# Altium project STM32F4_BerkwareDevBoard.PrjPcb
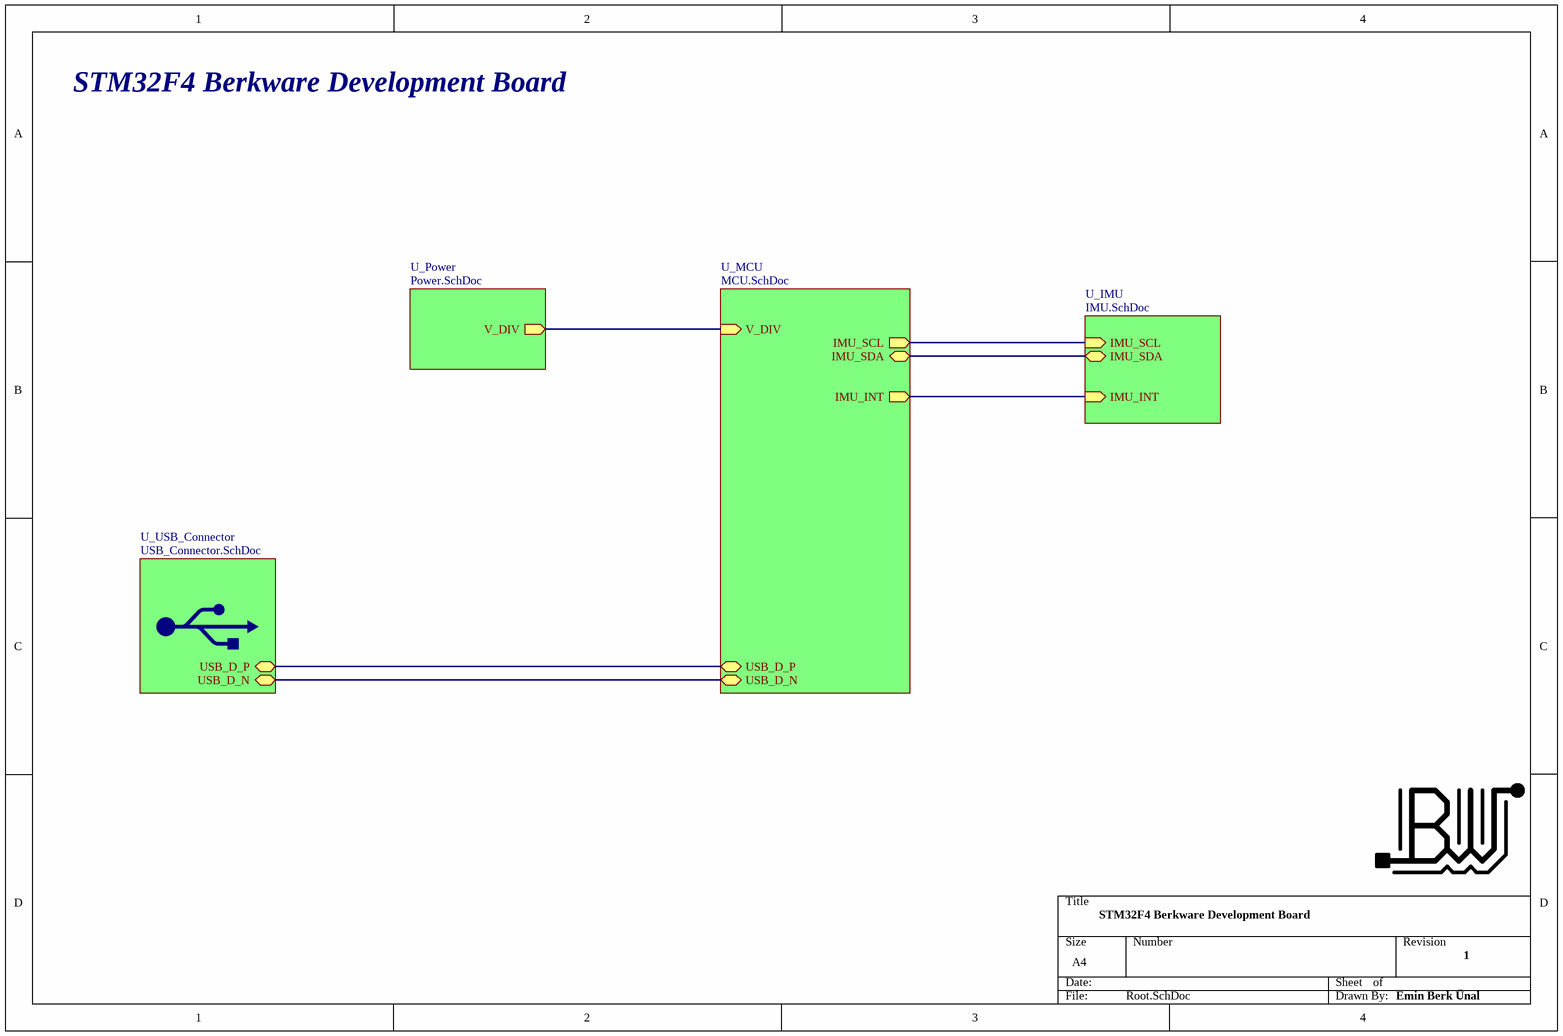
[diagram p0: Root.SchDoc]
5 sheets, 46 parts. Net scope: hierarchical (ports join the sheet entries above them; power ports are global).
Board file: STM32F4_BerkwareDevBoard.PcbDoc
Sheets:
  Root.SchDoc
    U_MCU = MCU.SchDoc
    U_IMU = IMU.SchDoc
    U_Power = Power.SchDoc
    U_USB_Connector = USB_Connector.SchDoc

## Sheet Root.SchDoc: STM32F4 Berkware Development Board
size A4; DrawnBy: Emin Berk Ünal; Revision: 1; SheetNumber: 1; SheetTotal: 5

### Sub-sheets
U_IMU = IMU.SchDoc: IMU_SCL (in), IMU_SDA (bidir), IMU_INT (in)
U_MCU = MCU.SchDoc: USB_D_P (bidir), USB_D_N (bidir), IMU_SCL (out), IMU_SDA (bidir), IMU_INT (out), V_DIV (in)
U_Power = Power.SchDoc: V_DIV (out)
U_USB_Connector = USB_Connector.SchDoc: USB_D_N (bidir), USB_D_P (bidir)

### Nets
IMU_INT: sheet U_MCU/IMU_INT, sheet U_IMU/IMU_INT
IMU_SCL: sheet U_MCU/IMU_SCL, sheet U_IMU/IMU_SCL
IMU_SDA: sheet U_MCU/IMU_SDA, sheet U_IMU/IMU_SDA
USB_D_N: sheet U_MCU/USB_D_N, sheet U_USB_Connector/USB_D_N
USB_D_P: sheet U_MCU/USB_D_P, sheet U_USB_Connector/USB_D_P
V_DIV: sheet U_MCU/V_DIV, sheet U_Power/V_DIV

### Notes on the sheet
- STM32F4 Berkware Development Board

## Sheet MCU.SchDoc
size A4; SheetNumber: 2; SheetTotal: 5
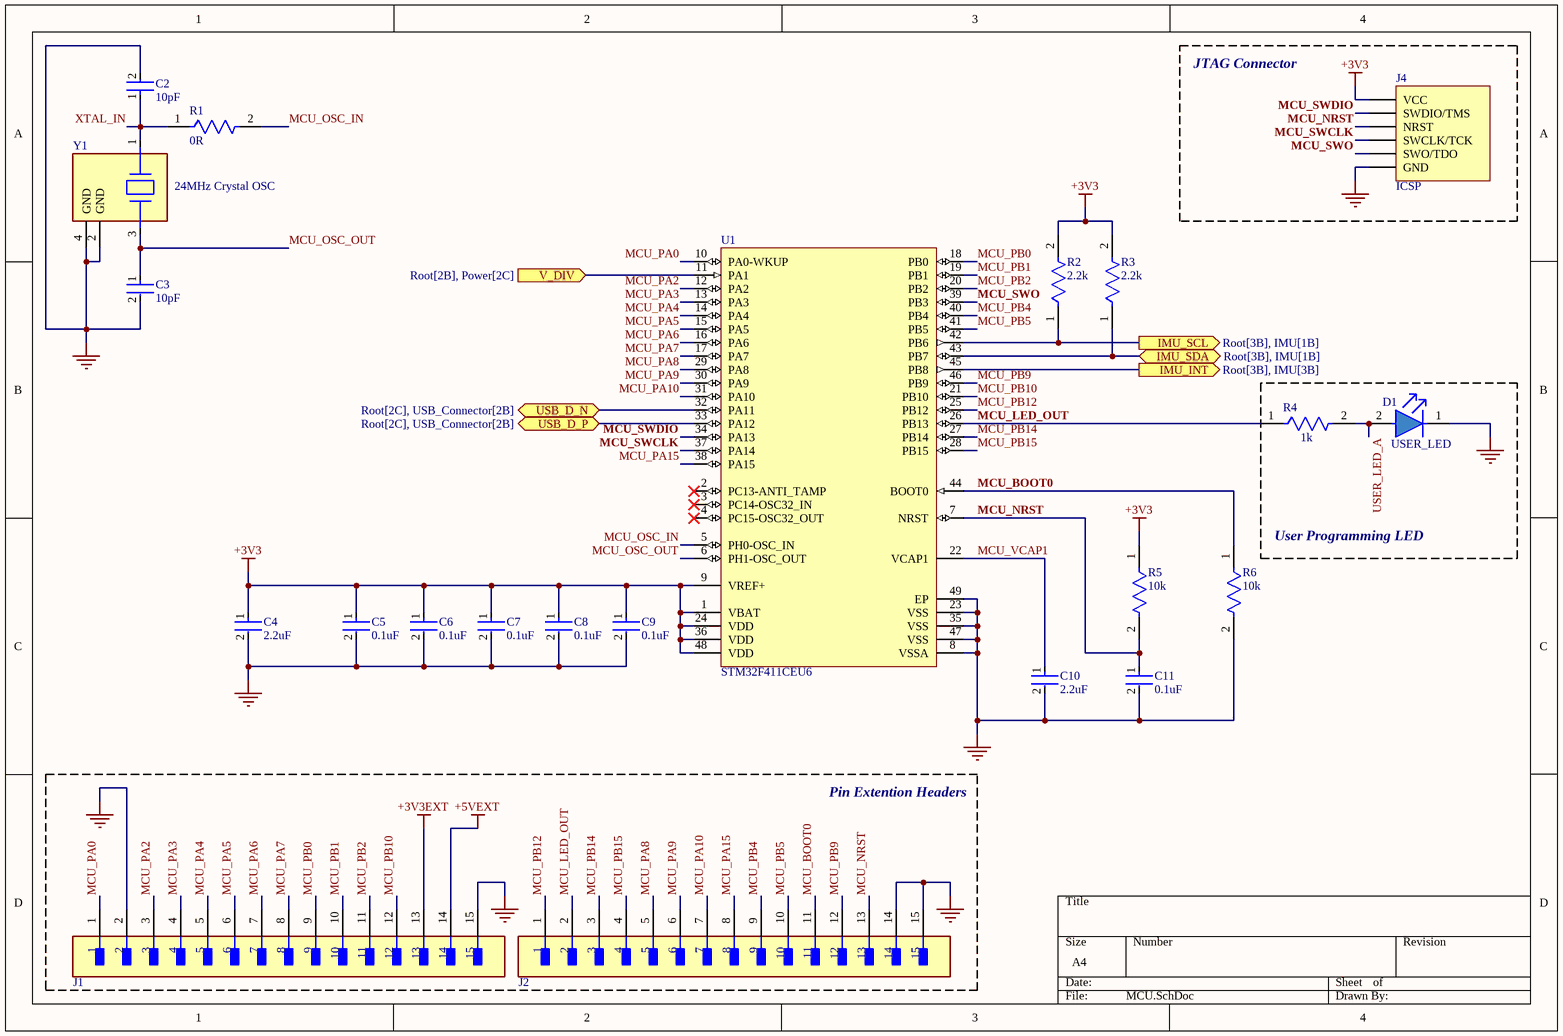
[diagram p1: MCU.SchDoc]

### Parts
C2  10pF  [FP-C0402-BB-MFG]
C3  10pF  [FP-C0402-BB-MFG]
C4  2.2uF  [FP-CC0603-DA-MFG]
C5  0.1uF  [FP-CC0402-MFG]
C6  0.1uF  [FP-CC0402-MFG]
C7  0.1uF  [FP-CC0402-MFG]
C8  0.1uF  [FP-CC0402-MFG]
C9  0.1uF  [FP-CC0402-MFG]
C10  2.2uF  [FP-CC0603-DA-MFG]
C11  0.1uF  [FP-CC0402-MFG]
D1  USER_LED  [FP-LTST-C191TBKT-MFG]
J1  TSW-115-23-T-S  [FP-TSW-115-23-T-S-MFG]  (value not drawn)
J2  TSW-115-23-T-S  [FP-TSW-115-23-T-S-MFG]  (value not drawn)
J4  ICSP  [TC2030-MCP-NL]  (no BOM)
R1  0R  [FP-MCS0402-MFG]
R2  2.2k  [FP-RT0402-MFG]
R3  2.2k  [FP-RT0402-MFG]
R4  1k  [FP-AT0402-MFG]
R5  10k  [FP-RT0402-MFG]
R6  10k  [FP-RT0402-MFG]
U1  STM32F411CEU6  [STM-UFQFPN48_L]
Y1  24MHz Crystal OSC  [FP-ABM10W-MFG]

### Blocks framed on the sheet
JTAG Connector: J4
User Programming LED: D1 R4

### Ports
IMU_INT (out, see Root[3B], IMU[3B]), IMU_SCL (out, see Root[3B], IMU[1B]), IMU_SDA (bidir, see Root[3B], IMU[1B]), USB_D_N (bidir, see Root[2C], USB_Connector[2B]), USB_D_P (bidir, see Root[2C], USB_Connector[2B]), V_DIV (in, see Root[2B], Power[2C])

### Nets
+3V3: C4.1 C5.1 C6.1 C7.1 C8.1 C9.1 J4.1(VCC) R2.2 R3.2 R5.1 U1.1(VBAT) U1.9(VREF+) U1.24(VDD) U1.36(VDD) U1.48(VDD)
+3V3EXT: J1.13
+5VEXT: J1.14
GND: C2.2 C3.2 C4.2 C5.2 C6.2 C7.2 C8.2 C9.2 C10.2 C11.2 D1.1(C) J1.2 J1.15 J2.14 J2.15 J4.5(GND) R6.2 U1.8(VSSA) U1.23(VSS) U1.35(VSS) U1.47(VSS) U1.49(EP) Y1.2(GND) Y1.4(GND)
IMU_INT: U1.45(PB8) ; port IMU_INT
IMU_SCL: R2.1 U1.42(PB6) ; port IMU_SCL
IMU_SDA: R3.1 U1.43(PB7) ; port IMU_SDA
MCU_BOOT0: J2.11 R6.1 U1.44(BOOT0)
MCU_LED_OUT: J2.2 R4.1 U1.26(PB13)
MCU_NRST: C11.1 J2.13 J4.3(NRST) R5.2 U1.7(NRST)
MCU_OSC_IN: R1.2 U1.5(PH0-OSC_IN)
MCU_OSC_OUT: C3.1 U1.6(PH1-OSC_OUT) Y1.3
MCU_PA0: J1.1 U1.10(PA0-WKUP)
MCU_PA2: J1.3 U1.12(PA2)
MCU_PA3: J1.4 U1.13(PA3)
MCU_PA4: J1.5 U1.14(PA4)
MCU_PA5: J1.6 U1.15(PA5)
MCU_PA6: J1.7 U1.16(PA6)
MCU_PA7: J1.8 U1.17(PA7)
MCU_PA8: J2.5 U1.29(PA8)
MCU_PA9: J2.6 U1.30(PA9)
MCU_PA10: J2.7 U1.31(PA10)
MCU_PA15: J2.8 U1.38(PA15)
MCU_PB0: J1.9 U1.18(PB0)
MCU_PB1: J1.10 U1.19(PB1)
MCU_PB2: J1.11 U1.20(PB2)
MCU_PB4: J2.9 U1.40(PB4)
MCU_PB5: J2.10 U1.41(PB5)
MCU_PB9: J2.12 U1.46(PB9)
MCU_PB10: J1.12 U1.21(PB10)
MCU_PB12: J2.1 U1.25(PB12)
MCU_PB14: J2.3 U1.27(PB14)
MCU_PB15: J2.4 U1.28(PB15)
MCU_SWCLK: J4.4(SWCLK/TCK) U1.37(PA14)
MCU_SWDIO: J4.2(SWDIO/TMS) U1.34(PA13)
MCU_SWO: J4.6(SWO/TDO) U1.39(PB3)
MCU_VCAP1: C10.1 U1.22(VCAP1)
USB_D_N: U1.32(PA11) ; port USB_D_N
USB_D_P: U1.33(PA12) ; port USB_D_P
USER_LED_A: D1.2(A) R4.2
V_DIV: U1.11(PA1) ; port V_DIV
XTAL_IN: C2.1 R1.1 Y1.1

Not connected (* = marked no-connect by the designer): U1 2(PC13-ANTI_TAMP)* 3(PC14-OSC32_IN)* 4(PC15-OSC32_OUT)*

### Notes on the sheet
- Pin Extention Headers

### Library data of the parts
C2 C3 = CMP-03020-018108-1: C0402 10 pF X7R 10.00% 16 V; Manufacturer: Kemet; Manufacturer Part Number: C0402C100K4RACAUTO; Tolerance: 0.1; Material: Ceramic; Temperature Coefficient: 15%; Voltage Rating: 16 V; Temperature: -55°C to +125°C; Ipc Land Pattern Name: CAPC10050X50; Temperature Characteristic: X7R; Automotive: No; ComponentLink2Description: Datasheet; Device Class L2: Capacitors; Temperature Range High: +125°C; ComponentLink2URL: https://content.kemet.com/datasheets/KEM_C1002_X7R_SMD.pdf; Device Class L1: Passive Components; Category: Cap; Value: 10 pF; Device Class L3: Ceramic Capacitors; Lead Free: Yes; Octopart: https://octopart.com/c0402c100k4racauto-kemet-91893731; RoHS: TRUE; Package: C0402-BB; Height: 0.55mm; Temperature Range Low: -55°C; Capacitance: 10 pF
C4 C10 = CMP-03422-000148-1: CAP CER 2.2UF 10V X7R 0603; Manufacturer: YAGEO; Manufacturer Part Number: CC0603KRX7R6BB225; Tolerance: 0.1; Temperature Coefficient: 15%; Material: Ceramic; Category: Cap; Temperature Range Low: -55°C; Device Class L1: Passive Components; ComponentLink2URL: http://www.yageo.com/documents/recent/UPY-GPHC_X7R_6.3V-to-50V_18.pdf; Value: 2.2 uF; Octopart: https://octopart.com/cc0603krx7r6bb225-yageo-20649696; Lead Free: Yes; Digikey Description: CAP CER 2.2UF 10V X7R 0603; Device Class L2: Capacitors; Height: 0.9mm; Package: CC0603-DA; Automotive: No; Voltage Rating: 10 V; Temperature Characteristic: X7R; Mouser Description: Multilayer Ceramic Capacitors MLCC - SMD/SMT 2.2uF 10V X7R 10%; Device Class L3: Ceramic Capacitors; Temperature Range High: +125°C; RoHS: TRUE; Temperature: -55°C to +125°C; Footprint Url: http://www.yageo.com/exep/pages/download/literatures/UPY-C_GEN_24.pdf; ComponentLink2Description: Datasheet; Voltage: 10 V; Capacitance: 2.2 uF
C5-C9 C11 = CMP-03422-001121-1: CAP CER 0.1UF 16V X7R 0402; Manufacturer: YAGEO; Manufacturer Part Number: CC0402KPX7R7BB104; Material: Ceramic; Temperature Coefficient: 30ppm/°C; Capacitance: 100 nF; Automotive Grade: NA; Value: 100 nF; Tolerance: 0.1; Digikey Description: CAP CER 0.1UF 16V X7R 0402; Temperature Range Low: -55°C; Footprint Url: http://www.yageo.com/exep/pages/download/literatures/UPY-C_GEN_24.pdf; RoHS: TRUE; Device Class L3: Ceramic Capacitors; Temperature Characteristic: X7R; Package: CC0402; Device Class L1: Passive Components; Lead Free: Yes; Temperature Range High: +125°C; Category: Cap; Mouser Description: 0402 0.1 uF 16 V ±10% Tolerance X7R SMT Multilayer Ceramic Capacitor; Voltage Rating: 16 V; ComponentLink2Description: Datasheet; Automotive: No; Octopart: https://octopart.com/cc0402kpx7r7bb104-yageo-21548559; ComponentLink2URL: http://www.yageo.com/documents/recent/UPY-GP_NP0_16V-to-50V_16.pdf; Height: 0.55mm; Device Class L2: Capacitors; Temperature: -55°C to +125°C; Ipc Land Pattern Name: CAPC10050X50
D1 = CMP-22017-000008-1: LED BLUE CLEAR CHIP SMD; Lens Color: Colorless; Dominant Wavelength: 475nm; Forward Current: 20mA; Wavelength: 468nm; Viewing Angle: 130°; Power Dissipation: 76mW; Luminous Intensity: 180mcd; Reverse Voltage: 5V; Number of Elements: 1; Lens Style: Diffused; Forward Voltage: 3.8V; Max Power Dissipation: 75mW; Case Code (Metric): 1608; Packaging: Tape and Reel; Case/Package: 0603; Depth: 1.6mm; Mount: Surface Mount; Lead Free: Lead Free; Min Operating Temperature: -20°C; Lens Transparency: Clear; Illumination Color: Blue; Height: 0.55mm; Test Current: 20mA; Case Code (Imperial): 0603; Max Operating Temperature: 80°C; Number of Pins: 2; Length: 0.8mm; Radiation Hardening: No; Package Quantity: 1; Number of LEDs: 1; Width: 0.8mm; Color: Blue
J1 J2 = CMP-02766-001466-1: CONN HEADER VERT 15POS 2.54MM; Connector Type: Male Pin; Number of Contacts: 15; Gender: Male; Pitch: 0.1inch; Termination: Solder; Packaging: Bulk; Lead Free: Lead Free; Housing Color: Black; Housing Material: Plastic; Color: Black; RoHS Compliant: Yes; Contact Type: Male Pin; Width: 2.54mm; Mount: Through Hole; Contact Material: Bronze; Number of Rows: 1; Radiation Hardening: No; Number of Positions: 15; Length: 38.1mm; REACH SVHC: No SVHC; Height: 2.54mm; Contact Plating: Tin; Series: TSW; Contact Mating Length: 0.23inch
R1 = CMP-02407-001042-1: RES SMD 1.2K OHM 1% 1/10W 0402; Resistance: 0mR; Voltage Rating: 50V; Max Power Dissipation: 100mW; Composition: Thin Film; Max Operating Temperature: 125°C; Number of Terminations: 2; Mount: Surface Mount; Packaging: Tape and Reel; REACH SVHC: No SVHC; Case Code (Metric): 1005; Package Quantity: 1; Radiation Hardening: No; Termination: Wraparound; Case Code (Imperial): 0402; Contact Plating: Tin; Depth: 0.5mm; Height: 0.015inch; Length: 1mm; Voltage Rating (DC): 50V; Power Rating: 100mW; Lead Free: Lead Free; Min Operating Temperature: -55°C; Military Standard: Not; Width: 0.02inch; Case/Package: 0402
R2 R3 = CMP-03412-019720-1: RES SMD 2.2K OHM 0.1% 1/16W 0402; Manufacturer: Yageo; Manufacturer Part Number: RT0402BRE072K2L; Power Rating: 0.063W; Temperature Coefficient: 50 ppm/°C; Value: 2.2KΩ; Tolerance: 0.001; Voltage Rating: 50V; ComponentLink2URL: http://www.yageo.com/documents/recent/PYu-RT_1-to-0.01_RoHS_L_9.pdf; RoHS: TRUE; Device Class L3: Chip SMD Resistors; Category: Res; Ipc Land Pattern Name: RESC10050X30; Series: RT; Lead Free: Yes; Device Class L1: Passive Components; Temperature Range Low: -55°C; Package: RT0402; Automotive: No; Octopart: https://octopart.com/rt0402bre072k2l-yageo-1445889; Temperature: -55°C to +155°C; Footprint Url: http://www.yageo.com/exep/pages/download/literatures/PYu-R_Mount_10.pdf; Composition: Thin Film; Resistance: 2.2KΩ; Temperature Range High: +155°C; Digikey Description: RES SMD 2.2K OHM 0.1% 1/16W 0402; Device Class L2: Resistors; ComponentLink2Description: Datasheet; Height: 0.35mm
R4 = CMP-03412-049230-1: Thin Film Chip Resistors Automotive Grade 1kΩ 1% 25ppm/°C 0402
R5 R6 = CMP-2002-02973-2: RES SMD 10K OHM 0.1% 1/16W 0402; Manufacturer Part Number: RT0402BRE0710KL; Manufacturer: Yageo; Power Rating: 0.063W; Resistance: 10KΩ; Temperature Coefficient: 50 ppm/°C; Tolerance: 0.001; Voltage Rating: 50V; Value: 10KΩ; Octopart: https://octopart.com/rt0402bre0710kl-yageo-1416557; Digikey Description: RES SMD 10K OHM 0.1% 1/16W 0402; Category: Res; Temperature Range Low: -55°C; Ipc Land Pattern Name: RESC10050X30; Automotive: No; Package: RT0402; Temperature: -55°C to +155°C; Series: RT; Lead Free: Yes; Device Class L3: Chip SMD Resistors; ComponentLink2URL: http://www.yageo.com/documents/recent/PYu-RT_1-to-0.01_RoHS_L_9.pdf; Height: 0.35mm; ComponentLink2Description: Datasheet; RoHS: TRUE; Composition: Thin Film; Device Class L2: Resistors; Device Class L1: Passive Components; Temperature Range High: +155°C; Footprint Url: http://www.yageo.com/exep/pages/download/literatures/PYu-R_Mount_10.pdf; Mouser Description: Res Thin Film 0402 10K Ohm 0.1% 1/16W ±50ppm/°C Molded SMD Paper T/R
U1 = CMP-0243-00165-1: ARM Cortex-M4 32-bit MCU+FPU, 512 KB Flash, 128 KB RAM, 36 I/Os, 48-Pin UFQFPN, -40 to 85 degC, Tray; Operating Frequency(F) (Processor speed) (MHz): 100; FLASH Size (Prog) (kB): 512; Internal RAM Size (kB): 128; I/Os (High Current): 36; Supply Voltage(Vcc) min (V): 1.7; Package Reference: 48-Pin Ultra Thin Fine Pitch Quad Flat No-Lead, 7 x 7 x 0.6 mm Body, 0.5 mm Pitch, Exposed Pad; ComponentLink1Description: Manufacturer URL; ComponentLink1URL: http://www.st.com/; Packing: Tray; Package Description: UFQFPN48; Core: ARM Cortex-M4; ComponentLink2Description: Datasheet; ComponentLink2URL: http://www.st.com/st-web-ui/static/active/en/resource/technical/document/datasheet/DM00115249.pdf; DatasheetVersion: Rev. 6; Mounting Technology: Surface Mount
Y1 = CMP-27762-001102-1: Crystal 24MHz ±20ppm 8pF SMD-4 2.5mm x 2mm

## Sheet IMU.SchDoc
size A4; SheetNumber: 3; SheetTotal: 5
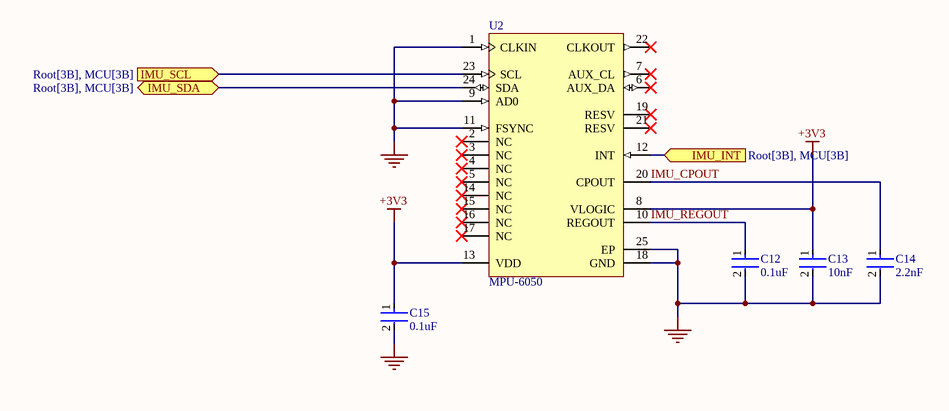
[diagram p2: IMU.SchDoc]

### Parts
C12  0.1uF  [FP-CC0402-MFG]
C13  10nF  [FP-C0402-BB-MFG]
C14  2.2nF  [FP-CC0402-MFG]
C15  0.1uF  [FP-CC0402-MFG]
U2  MPU-6050  [IS-QFN-24_V]

### Ports
IMU_INT (in, see Root[3B], MCU[3B]), IMU_SCL (in, see Root[3B], MCU[3B]), IMU_SDA (bidir, see Root[3B], MCU[3B])

### Nets
+3V3: C13.1 C15.1 U2.8(VLOGIC) U2.13(VDD)
GND: C12.2 C13.2 C14.2 C15.2 U2.1(CLKIN) U2.9(AD0) U2.11(FSYNC) U2.18(GND) U2.25(EP)
IMU_CPOUT: C14.1 U2.20(CPOUT)
IMU_INT: U2.12(INT) ; port IMU_INT
IMU_REGOUT: C12.1 U2.10(REGOUT)
IMU_SCL: U2.23(SCL) ; port IMU_SCL
IMU_SDA: U2.24(SDA) ; port IMU_SDA

Not connected (* = marked no-connect by the designer): U2 2(NC)* 3(NC)* 4(NC)* 5(NC)* 6(AUX_DA)* 7(AUX_CL)* 14(NC)* 15(NC)* 16(NC)* 17(NC)* 19(RESV)* 21(RESV)* 22(CLKOUT)*

### Library data of the parts
C12 C15 = CMP-03422-001121-1: as C5 on sheet MCU; Digikey Description: CAP CER 0.1UF 16V X7R 0402; Temperature Range Low: -55°C; Footprint Url: http://www.yageo.com/exep/pages/download/literatures/UPY-C_GEN_24.pdf; RoHS: TRUE; Device Class L3: Ceramic Capacitors; Temperature Characteristic: X7R; Package: CC0402; Device Class L1: Passive Components; Lead Free: Yes; Temperature Range High: +125°C; Category: Cap; Mouser Description: 0402 0.1 uF 16 V ±10% Tolerance X7R SMT Multilayer Ceramic Capacitor; Voltage Rating: 16 V; ComponentLink2Description: Datasheet; Automotive: No; Octopart: https://octopart.com/cc0402kpx7r7bb104-yageo-21548559; ComponentLink2URL: http://www.yageo.com/documents/recent/UPY-GP_NP0_16V-to-50V_16.pdf; Height: 0.55mm; Device Class L2: Capacitors; Temperature: -55°C to +125°C; Ipc Land Pattern Name: CAPC10050X50
C13 = CMP-2008-02186-2: CAP CER 10000PF 50V X7R 0402; Manufacturer: Kemet; Manufacturer Part Number: C0402C103K5RACAUTO; Temperature Coefficient: 15%; Material: Ceramic; Tolerance: 0.1; Value: 10,000 pF; Digikey Description: CAP CER 10000PF 50V X7R 0402; Voltage Rating: 50 V; Ipc Land Pattern Name: CAPC10050X50; Temperature Range High: +125°C; Package: C0402-BB; Octopart: https://octopart.com/c0402c103k5racauto-kemet-22884290; ComponentLink2Description: Datasheet; Temperature: -55°C to +125°C; Temperature Characteristic: X7R; Lead Free: Yes; Automotive: No; ComponentLink2URL: https://content.kemet.com/datasheets/KEM_C1002_X7R_SMD.pdf; Device Class L3: Ceramic Capacitors; Device Class L2: Capacitors; Device Class L1: Passive Components; Category: Cap; Height: 0.55mm; RoHS: TRUE; Capacitance: 10,000 pF; Temperature Range Low: -55°C; Mouser Description: Cap Ceramic 0.01uF 50V X7R 10% Pad SMD 0402 125C Automotive T/R
C14 = CMP-03422-000888-1: CAP CER 2200PF 10V X7R 0402; Manufacturer: YAGEO; Manufacturer Part Number: CC0402KRX7R6BB222; Material: Ceramic; Automotive Grade: NA; Tolerance: 0.1; Temperature Coefficient: 30ppm/°C; ComponentLink2Description: Datasheet; Capacitance: 2.2 nF; ComponentLink2URL: http://www.yageo.com/documents/recent/UPY-GP_NP0_16V-to-50V_16.pdf; Octopart: https://octopart.com/cc0402krx7r6bb222-yageo-71334368; Temperature: -55°C to +125°C; Ipc Land Pattern Name: CAPC10050X50; Value: 2.2 nF; Temperature Range High: +125°C; Footprint Url: http://www.yageo.com/exep/pages/download/literatures/UPY-C_GEN_24.pdf; RoHS: TRUE; Package: CC0402; Temperature Range Low: -55°C; Category: Cap; Device Class L3: Ceramic Capacitors; Height: 0.55mm; Lead Free: Yes; Digikey Description: CAP CER 2200PF 10V X7R 0402; Automotive: No; Voltage Rating: 10 V; Device Class L1: Passive Components; Temperature Characteristic: X7R; Device Class L2: Capacitors
U2 = CMP-1753-00002-2: 3-Axis Gyroscope, Accelerometer and a Digital Motion Processor(TM) (DMP), 2.375 to 3.46 V, -40 to 85 degC, 24-Pin QFN, RoHS, Tape and Reel; Manufacturer: InvenSense; Featured Product: MPU-60506-Axis,IntegratedI²CSolution; Other Names: 1428-1007-2 / MPU6050; Sensor Type: MotionTracking; Online Catalog: MPU-6000™Series; Unit PriceUSD: Digital; Datasheet Version: Rev. 3.3, 05/2012; Category: Sensors,Transducers; Datasheet URL: http://datasheet.octopart.com/MPU-6050-InvenSense-datasheet-14421344.pdf; Family: Multifunction; Standard Package: 5,000; Manufacturer URL: http://www.invensense.com/; Output Type: Digital; Dynamic Catalog: MPU-6000™Series

## Sheet Power.SchDoc
size A4; SheetNumber: 4; SheetTotal: 5
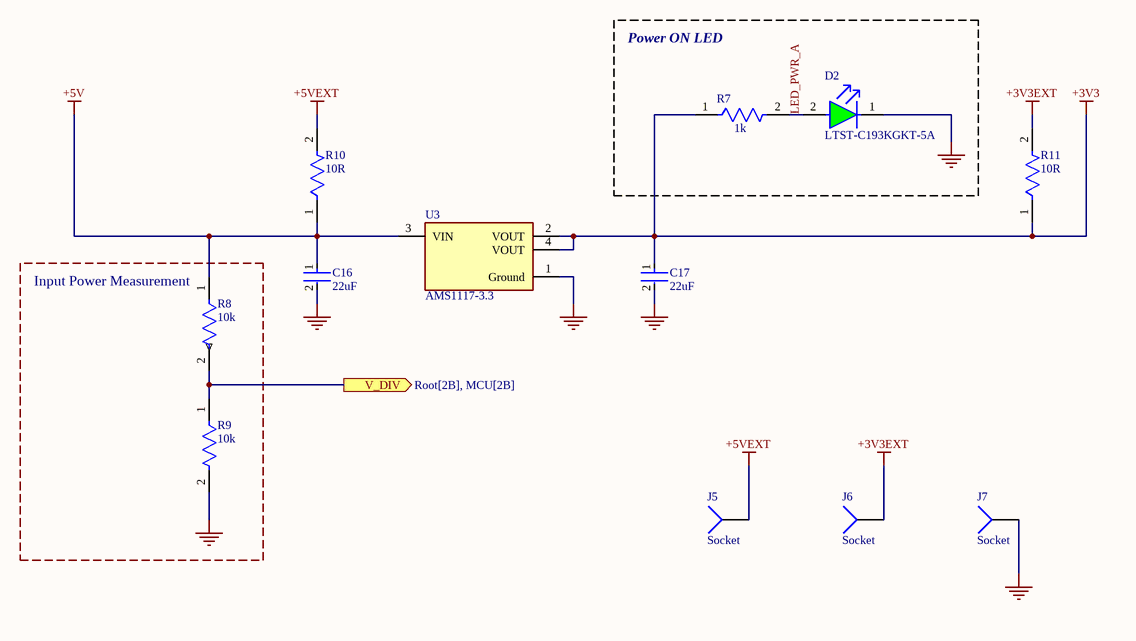
[diagram p3: Power.SchDoc]

### Parts
C16  22uF  [FP-CC0805-0_2-1_45-IPC_C]
C17  22uF  [FP-CC0805-0_2-1_45-IPC_C]
D2  LTST-C193KGKT-5A  [FP-LTST-C193KGKT-5A-MFG]
J5  Socket  [PIN1]  (no BOM)
J6  Socket  [PIN1]  (no BOM)
J7  Socket  [PIN1]  (no BOM)
R7  1k  [FP-AT0402-MFG]
R8  10k  [FP-RT0402-MFG]
R9  10k  [FP-RT0402-MFG]
R10  10R  [FP-AC0402-IPC_C]
R11  10R  [FP-AC0402-IPC_C]
U3  AMS1117-3.3  [FP-AMS1117-IPC_A]

### Blocks framed on the sheet
Power ON LED: D2 R7
Input Power Measurement: R8 R9

### Ports
V_DIV (out, see Root[2B], MCU[2B])

### Nets
+3V3: C17.1 R7.1 R11.1 U3.2(VOUT) U3.4(VOUT)
+3V3EXT: J6.1 R11.2
+5V: C16.1 R8.1 R10.1 U3.3(VIN)
+5VEXT: J5.1 R10.2
GND: C16.2 C17.2 D2.1(C) J7.1 R9.2 U3.1(Ground)
LED_PWR_A: D2.2(A) R7.2
V_DIV: R8.2 R9.1 ; port V_DIV

### Library data of the parts
C16 C17 = CMP-03422-001497-1: CAP CER 22UF 25V X5R 0805; Tolerance: 20%; Max Operating Temperature: 85°C; Dielectric: X5R; Termination: SMD/SMT; Voltage Rating: 25V; Width: 0.049inch; Min Operating Temperature: -55°C; Case/Package: 0805; Lead Free: Lead Free; RoHS Compliant: Yes; Weight: 0.000194oz; Voltage Rating (DC): 25V; Capacitance: 22uF; Length: 0.079inch; Halogen Free: Halogen Free; Height: 1.25mm; Packaging: Tape and Reel; Package Quantity: 3000; Case Code (Metric): 2012; Thickness: 0.057inch; Case Code (Imperial): 0805; Mount: Surface Mount
D2 = CMP-2000-06622-2: LED GREEN CLEAR CHIP SMD; Forward Current: 30mA; Power Dissipation: 75mW; Luminous Intensity: 28mcd; Lens Style: Diffused; Lens Color: Colorless; Forward Voltage: 2.3V; Test Current: 5mA; Viewing Angle: 130°; Reverse Voltage: 5V; Dominant Wavelength: 576.5nm; Number of Elements: 1; Number of Pins: 2; Case/Package: 0603; Width: 0.8mm; Radiation Hardening: No; Lead Free: Lead Free; Lens Transparency: Clear; Max Operating Temperature: 85°C; Illumination Color: Green; Color: Green; Packaging: Tape and Reel; Depth: 0.8mm; Length: 1.6mm; Mount: Surface Mount; Case Code (Imperial): 0603; Height: 0.35mm; Min Operating Temperature: -55°C; Package Quantity: 3000; Case Code (Metric): 1608; Power Rating: 75mW; Number of LEDs: 1
R7 = CMP-03412-049230-1: as R4 on sheet MCU
R8 R9 = CMP-2002-02973-2: as R5 on sheet MCU; Octopart: https://octopart.com/rt0402bre0710kl-yageo-1416557; Digikey Description: RES SMD 10K OHM 0.1% 1/16W 0402; Category: Res; Temperature Range Low: -55°C; Ipc Land Pattern Name: RESC10050X30; Automotive: No; Package: RT0402; Temperature: -55°C to +155°C; Series: RT; Lead Free: Yes; Device Class L3: Chip SMD Resistors; ComponentLink2URL: http://www.yageo.com/documents/recent/PYu-RT_1-to-0.01_RoHS_L_9.pdf; Height: 0.35mm; ComponentLink2Description: Datasheet; RoHS: TRUE; Composition: Thin Film; Device Class L2: Resistors; Device Class L1: Passive Components; Temperature Range High: +155°C; Footprint Url: http://www.yageo.com/exep/pages/download/literatures/PYu-R_Mount_10.pdf; Mouser Description: Res Thin Film 0402 10K Ohm 0.1% 1/16W ±50ppm/°C Molded SMD Paper T/R
R10 R11 = CMP-03412-027111-2: RES 10Ω ±1% 0.063W 0402; RoHS Compliant: Yes
U3 = CMP-209535-000001-1: LDO Voltage Regulators 1A, 3.3V; Manufacturer: Advanced Monolithic Systems; Dropout Voltage: 1.1V; Output Type: Fixed; Nominal Supply Current: 5mA; Max Power Dissipation: 1.2W; Max Supply Voltage: 15V; Number Of Outputs: 1; Standoff Height: 0.64mm; Max Junction Temp: +125°C; Height: 1.8mm; Package: AMS1117; Device Class L2: Power Management ICs; ComponentLink2Description: Datasheet; ComponentLink2URL: http://www.advanced-monolithic.com/pdf/ds1117.pdf; Category: IC; RoHS: TRUE; Automotive: No; Device Class L1: Integrated Circuits (ICs); Output Current: 1A; Device Class L3: Voltage Regulators - Linear; Temperature: -40°C to +125°C; Output Voltage: 3.3V; Manufacturer Part Number: AMS1117-3.3; Temperature Range Low: -40°C; Octopart: https://octopart.com/ams1117-3.3-advanced+monolithic+systems-25899300; Lead Free: Yes; Ipc Land Pattern Name: SOT229P700X180-4; Temperature Range High: +125°C
J5-J7 = Socket: LatestRevisionDate: 17-Jul-2002; LatestRevisionNote: Re-released for DXP Platform.; Publisher: Altium Limited

## Sheet USB_Connector.SchDoc
size A4; SheetNumber: 5; SheetTotal: 5
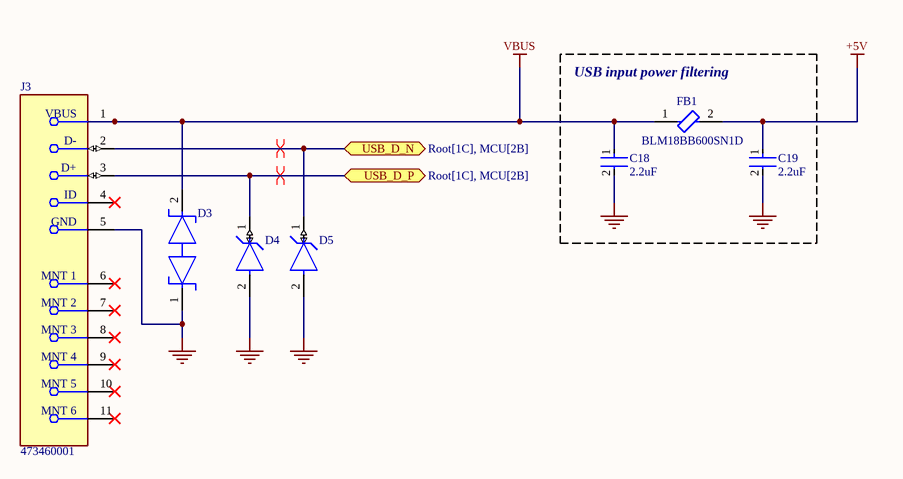
[diagram p4: USB_Connector.SchDoc]

### Parts
C18  2.2uF  [FP-CC0603-DA-MFG]
C19  2.2uF  [FP-CC0603-DA-MFG]
D3  TPD1E10B06DPYR  [FP-DPY0002A-MFG]  (value not drawn)
D4  ESD321DPYR  [FP-DPY0002A-MFG]  (value not drawn)
D5  ESD321DPYR  [FP-DPY0002A-MFG]  (value not drawn)
FB1  BLM18BB600SN1D  [FP-BLM18-0_15-t0_8-IPC_B]
J3  473460001  [FP-473460001-MFG]

### Blocks framed on the sheet
USB input power filtering: C18 C19 FB1

### Ports
USB_D_N (bidir, see Root[1C], MCU[2B]), USB_D_P (bidir, see Root[1C], MCU[2B])

### Nets
+5V: C19.1 FB1.2
GND: C18.2 C19.2 D3.1 D4.2(GND) D5.2(GND) J3.5(GND)
VBUS: C18.1 D3.2 FB1.1 J3.1(VBUS)
USB_D_N: D5.1(IO) J3.2(D-) ; port USB_D_N
USB_D_P: D4.1(IO) J3.3(D+) ; port USB_D_P

Not connected (* = marked no-connect by the designer): J3 4(ID)* 6(MNT_1)* 7(MNT_2)* 8(MNT_3)* 9(MNT_4)* 10(MNT_5)* 11(MNT_6)*

### Layout directives
differential pair; differential pair class DIFF_USB: USB_D_N, USB_D_P

### Library data of the parts
C18 C19 = CMP-03422-000148-1: as C4 on sheet MCU; Category: Cap; Temperature Range Low: -55°C; Device Class L1: Passive Components; ComponentLink2URL: http://www.yageo.com/documents/recent/UPY-GPHC_X7R_6.3V-to-50V_18.pdf; Value: 2.2 uF; Octopart: https://octopart.com/cc0603krx7r6bb225-yageo-20649696; Lead Free: Yes; Digikey Description: CAP CER 2.2UF 10V X7R 0603; Device Class L2: Capacitors; Height: 0.9mm; Package: CC0603-DA; Automotive: No; Voltage Rating: 10 V; Temperature Characteristic: X7R; Mouser Description: Multilayer Ceramic Capacitors MLCC - SMD/SMT 2.2uF 10V X7R 10%; Device Class L3: Ceramic Capacitors; Temperature Range High: +125°C; RoHS: TRUE; Temperature: -55°C to +125°C; Footprint Url: http://www.yageo.com/exep/pages/download/literatures/UPY-C_GEN_24.pdf; ComponentLink2Description: Datasheet; Voltage: 10 V; Capacitance: 2.2 uF
D3 = CMP-0326-00004-4: TVS DIODE 5.5V 14V 2X1SON; Leakage Current: 100nA; Min Breakdown Voltage: 6V; Number of Channels: 1; ESD Protection: Yes; Power Line Protection: No; Test Current: 1mA; Interface: GPIO; Element Configuration: Single; Peak Pulse Current: 5A; Direction: Bidirectional; Peak Pulse Power: 90W; Capacitance: 12pF; Composition: Zener; Packaging: Tape and Reel; Number of Pins: 2; Breakdown Voltage: 6V; Radiation Hardening: No; Min Operating Temperature: -40°C; Contact Plating: Gold; Lead Free: Lead Free; Height: 0.35mm; REACH SVHC: No SVHC; Case/Package: 0402; Max Operating Temperature: 125°C; Width: 0.7mm; Clamping Voltage: 14V; Package Quantity: 1; Max Reverse Leakage Current: 100nA; Working Voltage: 5.5V; Length: 1.1mm; Number of Bidirectional Channels: 1; Reverse Standoff Voltage: 5.5V
D4 D5 = CMP-04989-000001-1: HDMI2.0 ESD PROTECTION; Manufacturer: Texas Instruments; Standoff Height: 0mm; Peak Pulse Current: 6A; Value: 0.9pF; Number Of Channels: 1; Reverse Standoff Voltage: 3.6V; Peak Pulse Power: 40W; Breakdown Voltage: 4.5V; Direction: Unidirectional; Clamping Voltage: 6.8V; RoHS: TRUE; Temperature: -40°C to +125°C; Package: DPY0002A; Temperature Range Low: -40°C; Temperature Range High: +125°C; Category: Diode; Capacitance: 0.9pF; Ambient Temperature Range Low: -40°C; Device Class L3: unset; Device Class L1: Circuit Protection; Ambient Temperature Range High: +125°C; ComponentLink2URL: http://www.ti.com/lit/ds/symlink/esd321.pdf; Octopart: https://octopart.com/esd321dpyr-texas+instruments-94354200; Manufacturer Part Number: ESD321DPYR; Digikey Description: HDMI2.0 ESD PROTECTION; Lead Free: Yes; ComponentLink2Description: Datasheet; Device Class L2: TVS Diodes; Height: 0.45mm; Automotive: No
FB1 = CMP-0686-00415-3: Chip Ferrite Bead, 0603, 60Ω @ 100MHz, 0.25Ω, 25%, 600mA; Impedance: 60R; Current Rating: 550mA; Number of Circuits: 1; Shielding: Unshielded; Resistance: 350mR; Material: Steel; DC Resistance (DCR): 250mR; REACH SVHC: No SVHC; Height: 0.8mm; Packaging: Tape and Reel; Military Standard: Not; Case/Package: 0603; Lead Free: Lead Free; Termination: SMD/SMT; Length: 1.6mm; Case Code (Imperial): 0603; Package Quantity: 1; RoHS Compliant: Yes; DC Current: 550mA; Core Material: Ferrite; Max DC Current: 550mA; Radiation Hardening: No; Number of Pins: 2; Width: 0.8mm; Series: BLM18B; Depth: 0.8mm; Tolerance: 25%; Number of Lines: 1; Case Code (Metric): 1608; Max Current Rating: 550mA; Test Frequency: 100MHz; Min Operating Temperature: -55°C; Max Operating Temperature: 125°C
J3 = CMP-2000-05246-2: CONN RCPT USB2.0 MICRO B SMD R/A; Manufacturer: Molex; Conn Orientation: Right Angle; Is Female: yes; Shielding: true; Pitch: 0.65mm; Number Of Contacts: 5; Voltage Rating: 30V; Current Rating: 1.8A; Device Class L2: USB Connectors; Digikey Description: CONN RCPT USB2.0 MICRO B SMD R/A; Height: 2.945mm; RoHS: TRUE; ComponentLink2Description: Datasheet; Octopart: https://octopart.com/47346-0001-molex-7164928; Automotive: No; Package: 0; Category: Conn; Device Class L1: Connectors; Usb Standard: USB 2.0; Temperature: -30°C to +85°C; Temperature Range Low: -30°C; Footprint Url: https://www.molex.com/pdm_docs/sd/473460001_sd.pdf; ComponentLink2URL: https://www.molex.com/webdocs/datasheets/pdf/en-us/0473460001_IO_CONNECTORS.pdf; Lead Free: Yes; Manufacturer Part Number: 473460001; Contact Material: Gold,Nickel; Temperature Range High: +85°C; Device Class L3: unset

## Nets that join several sheets
+3V3: MCU (15 pins), IMU (C13.1 C15.1 U2.8 U2.13), Power (5 pins)
+3V3EXT: MCU (J1.13), Power (J6.1 R11.2)
+5V: Power (C16.1 R8.1 R10.1 U3.3), USB_Connector (C19.1 FB1.2)
+5VEXT: MCU (J1.14), Power (J5.1 R10.2)
GND: MCU (24 pins), IMU (9 pins), Power (6 pins), USB_Connector (6 pins)
IMU_INT: MCU (U1.45), IMU (U2.12)
IMU_SCL: MCU (R2.1 U1.42), IMU (U2.23)
IMU_SDA: MCU (R3.1 U1.43), IMU (U2.24)
USB_D_N: MCU (U1.32), USB_Connector (D5.1 J3.2)
USB_D_P: MCU (U1.33), USB_Connector (D4.1 J3.3)
V_DIV: MCU (U1.11), Power (R8.2 R9.1)